# Altium schematic sheet TPS7A88_3V3_1V8_0V9V@2x1A.SchDoc
size A4
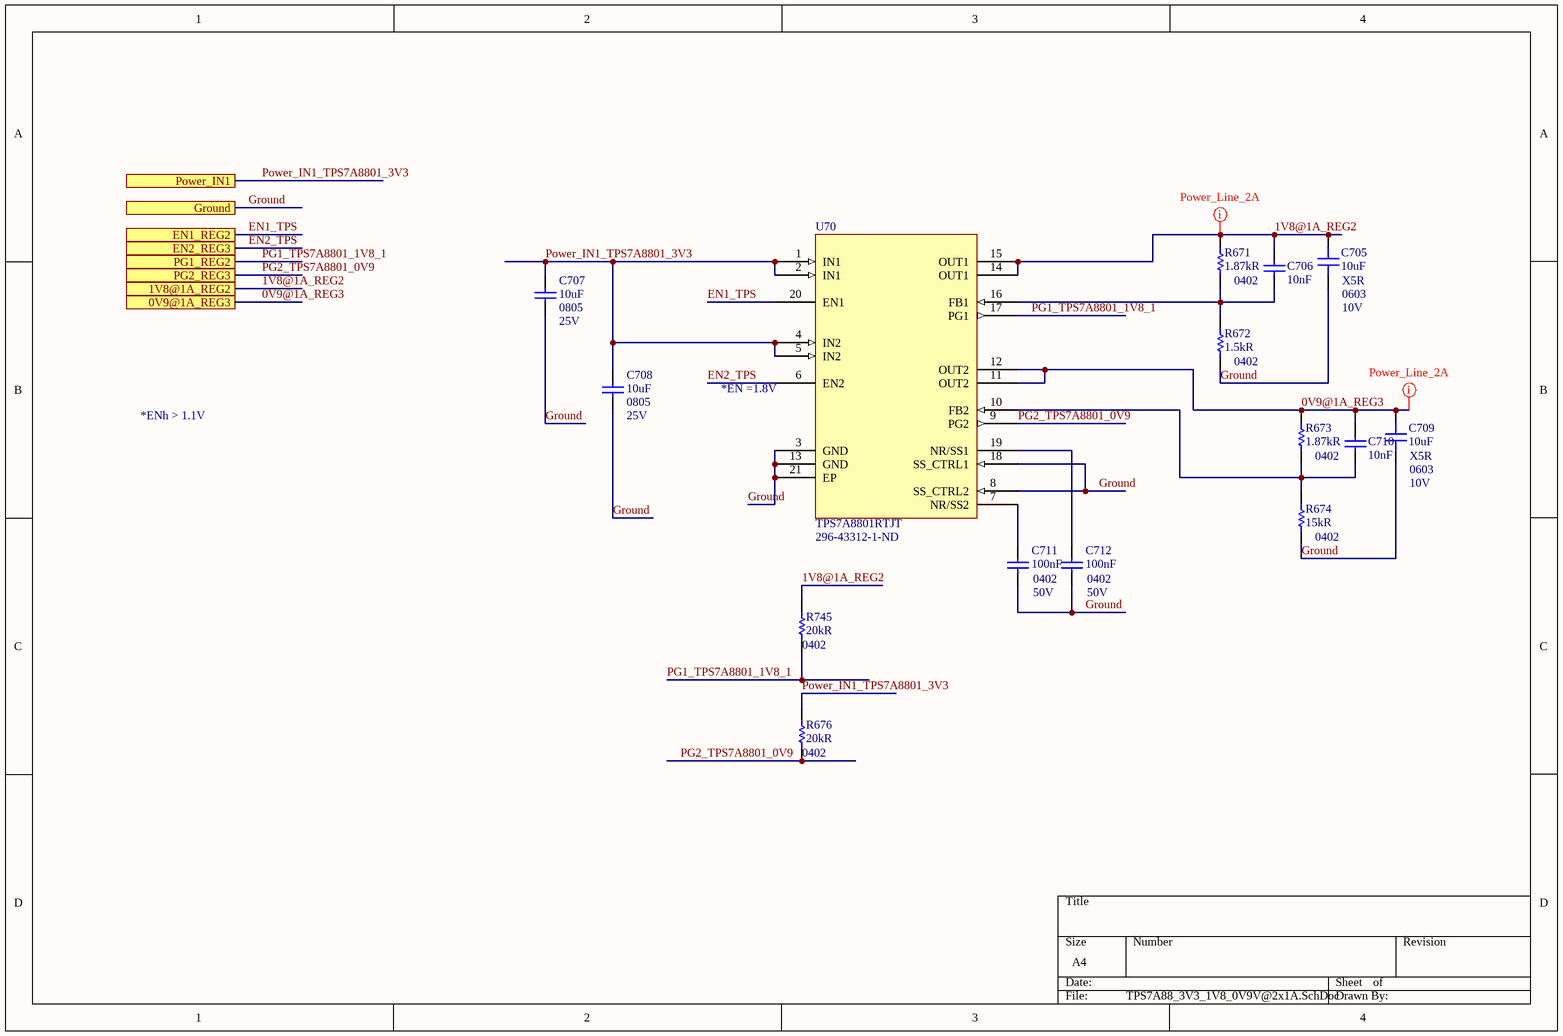
[diagram p0: TPS7A88_3V3_1V8_0V9V@2x1A.SchDoc]

## Parts
C705  10uF  Case/Package: 0603  Dielectric: X5R  Voltage Rating: 10V  [CAP 0603/1608 RF]
C706  10nF  [CAP 0201/0603 KK]
C707  10uF  Case/Package: 0805  Voltage Rating: 25V  [CAP 0805/2012 RF]
C708  10uF  Case/Package: 0805  Voltage Rating: 25V  [CAP 0805/2012 RF]
C709  10uF  Case/Package: 0603  Dielectric: X5R  Voltage: 10V  [CAP 0603/1608 RF]
C710  10nF  [CAP 0201/0603 KK]
C711  100nF  Case Code (Imperial): 0402  Voltage: 50V  [CAP 0402/1005 KK]
C712  100nF  Case Code (Imperial): 0402  Voltage: 50V  [CAP 0402/1005 KK]
R671  1.87kR  Case/Package: 0402  [RES 0402/1005 RF KK]
R672  1.5kR  Case/Package: 0402  [RES 0402/1005 RF KK]
R673  1.87kR  Case/Package: 0402  [RES 0402/1005 RF KK]
R674  15kR  Case Code (Imperial): 0402  [RES 0402/1005 RF KK]
R676  20kR  Case/Package: 0402  [RES 0402/1005 RF KK]
R745  20kR  Case/Package: 0402  [RES 0402/1005 RF KK]
U70  TPS7A8801RTJT  Supplier Part Number 1: 296-43312-1-ND  [TPS7A88]

## Ports
0V9@1A_REG3, 1V8@1A_REG2, EN1_REG2, EN2_REG3, Ground, PG1_REG2, PG2_REG3, Power_IN1

## Nets
0V9@1A_REG3: C709.2 C710.2 R673.2 U70.11(OUT2) U70.12(OUT2) ; port 0V9@1A_REG3
1V8@1A_REG2: C705.2 C706.2 R671.2 R745.1 U70.14(OUT1) U70.15(OUT1) ; port 1V8@1A_REG2
EN1_TPS: U70.20(EN1) ; port EN1_REG2
EN2_TPS: U70.6(EN2) ; port EN2_REG3
Ground: C705.1 C707.1 C708.1 C709.1 C711.1 C712.1 R672.1 R674.1 U70.3(GND) U70.8(SS_CTRL2) U70.13(GND) U70.18(SS_CTRL1) U70.21(EP) ; port Ground
PG1_TPS7A8801_1V8_1: R745.2 U70.17(PG1) ; port PG1_REG2
PG2_TPS7A8801_0V9: R676.2 U70.9(PG2) ; port PG2_REG3
Power_IN1_TPS7A8801_3V3: C707.2 C708.2 R676.1 U70.1(IN1) U70.2(IN1) U70.4(IN2) U70.5(IN2) ; port Power_IN1
NetC706_1: C706.1 R671.1 R672.2 U70.16(FB1)
NetC710_1: C710.1 R673.1 R674.2 U70.10(FB2)
NetC711_2: C711.2 U70.7(NR/SS2)
NetC712_2: C712.2 U70.19(NR/SS1)

## Layout directives
net class Power_Line_2A: 0V9@1A_REG3, 1V8@1A_REG2

## Notes on the sheet
- *ENh > 1.1V
- (near U70) *EN =1.8V

## Library data of the parts
C705 C709 = Capacitor: Manufacturer: Murata; Manufacturer Part Number: GRM188R61A106KE69D; Tolerance: 10%; Supplier 1: Digi-Key; Supplier Part Number 1: 490-10474-1-ND; Stock 1: 4597169; Pricing 1: 1 = 0,21000, 10 = 0,14000, 100 = 0,07110, 500 = 0,04864, 1000 = 0,04303 (USD); RoHS: Yes; Mount: Surface Mount; Case Code (Metric): 1608; Case Code (Imperial): 0603; Min Operating Temperature: -55°C; Max Operating Temperature: 85°C; Capacitance: 10uF; Packaging: Tape and Reel; Voltage Rating (DC): 10V; Length: 1.6mm; Height: 0.8mm; Width: 0.031inch; Thickness: 0.037inch; Depth: 0.8mm; REACH SVHC: No SVHC; Lead Free: Lead Free; ComponentLink1URL: http://components.arrow.com/part/dataview/0323_07281717?src-supplier=Arrow+Europe; ComponentLink1Description: http://components.arrow.com/part/dataview/0323_07281717?src-supplier=Arrow+Europe; ComponentLink2URL: http://www.farnell.com/datasheets/1955682.pdf?src-supplier=Farnell; ComponentLink2Description: http://www.farnell.com/datasheets/1955682.pdf?src-supplier=Farnell; ComponentLink3URL: http://www.mouser.com/ds/2/281/c02e-2905.pdf?src-supplier=Mouser; ComponentLink3Description: http://www.mouser.com/ds/2/281/c02e-2905.pdf?src-supplier=Mouser; ComponentLink4URL: http://search.murata.co.jp/Ceramy/image/img/A01X/G101/ENG/GRM188R61A106KE69-01.pdf?src-supplier=Digi-Key; ComponentLink4Description: http://search.murata.co.jp/Ceramy/image/img/A01X/G101/ENG/GRM188R61A106KE69-01.pdf?src-supplier=Digi-Key; ComponentLink5URL: http://www.farnell.com/datasheets/1955682.pdf?src-supplier=Element14; ComponentLink5Description: http://www.farnell.com/datasheets/1955682.pdf?src-supplier=Element14; ComponentLink6URL: http://www.farnell.com/datasheets/1955682.pdf?src-supplier=Newark; ComponentLink6Description: http://www.farnell.com/datasheets/1955682.pdf?src-supplier=Newark; ComponentLink7URL: http://psearch.en.murata.com/capacitor/product/GRM188R61A106KE69%23.pdf?src-supplier=Avnet; ComponentLink7Description: http://psearch.en.murata.com/capacitor/product/GRM188R61A106KE69%23.pdf?src-supplier=Avnet
  C705: Voltage: 10V
  C709: Voltage Rating: 10V
C706 C710 = Capacitor: CAP CER 10000PF 16V X7R 0201; Manufacturer: Murata; Manufacturer Part Number: GRM033R71C103KE14D; Tolerance: 10%; Supplier 1: Digi-Key; Supplier Part Number 1: 490-14453-1-ND; RoHS: No; Category: Ceramic Capacitors; Stock 1: 188777; Pricing 1: 1=0,10000, 10=0,01900, 100=0,00870, 500=0,00620, 1000=0,00487, 2500=0,00443, 5000=0,00407 (USD); Voltage Rating (DC): 16V; Dielectric: X7R; Capacitance: 10nF; Length: 600um; Width: 300um; Thickness: 300um; ComponentLink1URL: http://www.farnell.com/datasheets/2722745.pdf?src-supplier=Farnell; ComponentLink1Description: http://www.farnell.com/datasheets/2722745.pdf?src-supplier=Farnell; ComponentLink2URL: http://www.farnell.com/datasheets/2722745.pdf?src-supplier=Newark; ComponentLink2Description: http://www.farnell.com/datasheets/2722745.pdf?src-supplier=Newark; ComponentLink3URL: http://www.farnell.com/datasheets/2722745.pdf?src-supplier=Element14; ComponentLink3Description: http://www.farnell.com/datasheets/2722745.pdf?src-supplier=Element14; ComponentLink4URL: http://search.murata.co.jp/Ceramy/image/img/A01X/G101/ENG/GRM033R71C103KE14-01.pdf?src-supplier=Digi-Key; ComponentLink4Description: http://search.murata.co.jp/Ceramy/image/img/A01X/G101/ENG/GRM033R71C103KE14-01.pdf?src-supplier=Digi-Key
C707 C708 = Capacitor: CAP CER 10UF 25V X5R 0805; Manufacturer: KEMET; Manufacturer Part Number: C0805C106K3PACTU; Dielectric Material: Ceramic; Dissipation Factor: 10%; Supplier 1: Digi-Key; Supplier Part Number 1: 399-11939-6-ND; RoHS: Yes; Category: Ceramic Capacitors; Stock 1: 4800; Pricing 1: 1=0,24000, 10=0,16800, 100=0,09510, 500=0,06710, 1000=0,05872 (USD); Mount: Surface Mount; Case Code (Metric): 2012; Case Code (Imperial): 0805; Min Operating Temperature: -55°C; Max Operating Temperature: 85°C; Dielectric: X5R; Packaging: Cut Tape; Voltage: 25V; Termination: Solder; Tolerance: 10%; Voltage Rating (DC): 25V; Capacitance: 10uF; Length: 0.079inch; Height: 1.25mm; Depth: 1.25mm; Width: 0.049inch; Thickness: 0.057inch; REACH SVHC: No SVHC; Lead Free: Lead Free; ComponentLink1URL: http://www.farnell.com/datasheets/2741185.pdf?src-supplier=Farnell; ComponentLink1Description: http://www.farnell.com/datasheets/2741185.pdf?src-supplier=Farnell; ComponentLink2URL: http://www.farnell.com/datasheets/2112054.pdf?src-supplier=Farnell; ComponentLink2Description: http://www.farnell.com/datasheets/2112054.pdf?src-supplier=Farnell; ComponentLink3URL: http://www.alliedelec.com/m/d/f3c02ddb98afa3dd1adcb801109671e9.pdf?src-supplier=Allied+Electronics; ComponentLink3Description: http://www.alliedelec.com/m/d/f3c02ddb98afa3dd1adcb801109671e9.pdf?src-supplier=Allied+Electronics; ComponentLink4URL: http://www.farnell.com/datasheets/2112054.pdf?src-supplier=Element14; ComponentLink4Description: http://www.farnell.com/datasheets/2112054.pdf?src-supplier=Element14; ComponentLink5URL: https://api.kemet.com/component-edge/download/datasheet/C0805C106K3PAC7800.pdf?src-supplier=Digi-Key; ComponentLink5Description: https://api.kemet.com/component-edge/download/datasheet/C0805C106K3PAC7800.pdf?src-supplier=Digi-Key; ComponentLink6URL: http://www.kemet.com/docfinder?Partnumber=C0805C106K3PAC7800&src-supplier=Digi-Key; ComponentLink6Description: http://www.kemet.com/docfinder?Partnumber=C0805C106K3PAC7800&src-supplier=Digi-Key; ComponentLink7URL: http://www.kemet.com/Lists/ProductCatalog/Attachments/19/KEM_C1006_X5R_SMD.pdf?src-supplier=Avnet; ComponentLink7Description: http://www.kemet.com/Lists/ProductCatalog/Attachments/19/KEM_C1006_X5R_SMD.pdf?src-supplier=Avnet
C711 C712 = Capacitor: CAP CER 0.1UF 50V X5R 0402; Manufacturer: Murata; Manufacturer Part Number: GRM155R61H104KE14D; Dielectric Material: Ceramic; Dissipation Factor: 0.025%; Tolerance: 10%; Supplier 1: Digi-Key; Supplier Part Number 1: 490-10697-1-ND; RoHS: Yes; Category: Ceramic Capacitors; Stock 1: 435607; Pricing 1: 1=0,10000, 10=0,04600, 100=0,02050, 500=0,01464, 1000=0,01150, 2500=0,01045, 5000=0,00961 (USD); Mount: Surface Mount; Case/Package: 0402; Weight: 0.000212oz; Case Code (Metric): 1005; Min Operating Temperature: -55°C; Max Operating Temperature: 85°C; Capacitance: 100nF; Packaging: Tape and Reel; Voltage Rating: 50V; Dielectric: X5R; Termination: SMD/SMT; Composition: Ceramic; Voltage Rating (DC): 50V; Package Quantity: 10000; Length: 1mm; Height: 0.5mm; Width: 0.02inch; Thickness: 0.022inch; Depth: 0.5mm; REACH SVHC: No SVHC; Lead Free: Lead Free; ComponentLink1URL: http://www.farnell.com/datasheets/2079150.pdf?src-supplier=Farnell; ComponentLink1Description: http://www.farnell.com/datasheets/2079150.pdf?src-supplier=Farnell; ComponentLink2URL: http://www.mouser.com/ds/2/281/c02e-2905.pdf?src-supplier=Mouser; ComponentLink2Description: http://www.mouser.com/ds/2/281/c02e-2905.pdf?src-supplier=Mouser; ComponentLink3URL: http://www.farnell.com/datasheets/2079150.pdf?src-supplier=Element14; ComponentLink3Description: http://www.farnell.com/datasheets/2079150.pdf?src-supplier=Element14; ComponentLink4URL: http://search.murata.co.jp/Ceramy/image/img/A01X/G101/ENG/GRM155R61H104KE14-01.pdf?src-supplier=Digi-Key; ComponentLink4Description: http://search.murata.co.jp/Ceramy/image/img/A01X/G101/ENG/GRM155R61H104KE14-01.pdf?src-supplier=Digi-Key
R671 R673 = Resistor: Manufacturer: Panasonic; Manufacturer Part Number: ERA-2AEB1871X; Power Rating: 62.5mW; Tolerance: 0.1%; Temperature Coefficient: 25ppm/°C; Max Power Dissipation: 63mW; Supplier 1: Digi-Key; Supplier Part Number 1: P1.87KDCCT-ND; Stock 1: 25484; Pricing 1: 1 = 0,45000, 10 = 0,32100, 100 = 0,12830, 1000 = 0,06322, 2500 = 0,05858, 5000 = 0,05300 (USD); RoHS: Yes; Mount: Surface Mount; Case Code (Metric): 1005; Case Code (Imperial): 0402; Min Operating Temperature: -55°C; Max Operating Temperature: 155°C; Resistance: 1.87kR; Packaging: Tape and Reel; Package Quantity: 10000; Composition: Thin Film; Number of Terminations: 2; Length: 0.039inch; Height: 0.016inch; Width: 0.02inch; Lead Free: Lead Free; ComponentLink1URL: https://media.digikey.com/pdf/Data%20Sheets/Panasonic%20Resistors%20Thermistors%20PDFs/ERA_Series_LE.pdf?src-supplier=Digi-Key; ComponentLink1Description: https://media.digikey.com/pdf/Data%20Sheets/Panasonic%20Resistors%20Thermistors%20PDFs/ERA_Series_LE.pdf?src-supplier=Digi-Key; ComponentLink2URL: http://components.arrow.com/part/dataview/48289000S454828N1386?src-supplier=Arrow; ComponentLink2Description: http://components.arrow.com/part/dataview/48289000S454828N1386?src-supplier=Arrow; ComponentLink3URL: http://www.mouser.com/ds/2/315/AOA0000C237-1100991.pdf?src-supplier=Mouser; ComponentLink3Description: http://www.mouser.com/ds/2/315/AOA0000C237-1100991.pdf?src-supplier=Mouser; ComponentLink4URL: http://www.onlinecomponents.com/datasheet/era-2aeb1871x.aspx?p=44473586&src-supplier=Onlinecomponents.com; ComponentLink4Description: http://www.onlinecomponents.com/datasheet/era-2aeb1871x.aspx?p=44473586&src-supplier=Onlinecomponents.com; ComponentLink5URL: https://industrial.panasonic.com/cdbs/www-data/pdf/RDM0000/AOA0000C307.pdf?src-supplier=Digi-Key; ComponentLink5Description: https://industrial.panasonic.com/cdbs/www-data/pdf/RDM0000/AOA0000C307.pdf?src-supplier=Digi-Key
R672 = Resistor: Manufacturer: Panasonic; Manufacturer Part Number: ERA-2AEB152X; Power Rating: 63mW; Tolerance: 0.1%; Voltage Rating: 25V; Temperature Coefficient: 25ppm/°C; Supplier 1: Digi-Key; Supplier Part Number 1: P1.5KDCCT-ND; Stock 1: 3629; Pricing 1: 1 = 0,43000, 10 = 0,30500, 100 = 0,12220, 1000 = 0,06021, 2500 = 0,05579, 5000 = 0,05047 (USD); RoHS: Yes; Mount: Surface Mount; Case Code (Metric): 1005; Case Code (Imperial): 0402; Contact Plating: Tin; Min Operating Temperature: -55°C; Max Operating Temperature: 155°C; Resistance: 1.5kR; Packaging: Tape and Reel; Package Quantity: 10000; Composition: Thin Film,Metal Film; Number of Terminations: 2; Termination: SMD/SMT; Military Standard: Not; Max Power Dissipation: 63mW; Voltage Rating (DC): 25V; Features: Automotive AEC-Q200; Length: 1mm; Height: 0.35mm; Width: 0.02inch; Depth: 0.5mm; Radiation Hardening: No; REACH SVHC: No SVHC; Lead Free: Lead Free; ComponentLink1URL: https://datasheet.ciiva.com/11812/0900766b80beefcc-11812726.pdf?src-supplier=RSComponents; ComponentLink1Description: https://datasheet.ciiva.com/11812/0900766b80beefcc-11812726.pdf?src-supplier=RSComponents; ComponentLink2URL: https://datasheet.ciiva.com/9198/aoa0000ce26-9198134.pdf?src-supplier=Avnet; ComponentLink2Description: https://datasheet.ciiva.com/9198/aoa0000ce26-9198134.pdf?src-supplier=Avnet; ComponentLink3URL: https://datasheet.ciiva.com/17214/aoa0000ce26-17214729.pdf?src-supplier=Avnet+Europe; ComponentLink3Description: https://datasheet.ciiva.com/17214/aoa0000ce26-17214729.pdf?src-supplier=Avnet+Europe; ComponentLink4URL: https://datasheet.ciiva.com/24071/aoa0000ce26-197354-24071641.pdf?src-supplier=Mouser; ComponentLink4Description: https://datasheet.ciiva.com/24071/aoa0000ce26-197354-24071641.pdf?src-supplier=Mouser
R674 = Resistor: Manufacturer: Panasonic; Manufacturer Part Number: ERJ-2RKF1502X; Tolerance: 1%; Voltage Rating: 50V; Power Rating: 100mW; Temperature Coefficient: 100ppm/°C; Supplier 1: Digi-Key; Supplier Part Number 1: P15.0KLDKR-ND; Stock 1: 3339464; Pricing 1: 1 = 0,10000, 10 = 0,04100, 100 = 0,01670, 1000 = 0,00751, 2500 = 0,00652, 5000 = 0,00538 (USD); RoHS: Yes; Mount: Surface Mount; Case/Package: 0402; Number of Pins: 2; Weight: 2.8E-05oz; Case Code (Metric): 1005; Contact Plating: Tin; Min Operating Temperature: -55°C; Max Operating Temperature: 155°C; Resistance: 15kR; Packaging: Tape and Reel; Package Quantity: 1; Composition: Thick Film; Termination: SMD/SMT; Number of Terminations: 2; Military Standard: Not; Max Power Dissipation: 100mW; Voltage Rating (DC): 50V; Features: Automotive AEC-Q200; Length: 1mm; Height: 0.35mm; Width: 0.5mm; Depth: 0.5mm; Radiation Hardening: No; REACH SVHC: No SVHC; Lead Free: Lead Free; ComponentLink1URL: https://datasheet.ciiva.com/11821/0900766b80f80784-11821181.pdf?src-supplier=RSComponents; ComponentLink1Description: https://datasheet.ciiva.com/11821/0900766b80f80784-11821181.pdf?src-supplier=RSComponents; ComponentLink2URL: https://datasheet.ciiva.com/16778/70260748-16778682.pdf?src-supplier=Allied+Electronics; ComponentLink2Description: https://datasheet.ciiva.com/16778/70260748-16778682.pdf?src-supplier=Allied+Electronics; ComponentLink3URL: https://datasheet.ciiva.com/46372/1678782-46372862.pdf?src-supplier=Element14; ComponentLink3Description: https://datasheet.ciiva.com/46372/1678782-46372862.pdf?src-supplier=Element14; ComponentLink4URL: https://datasheet.ciiva.com/17211/aoa0000ce2-17211535.pdf?src-supplier=Avnet+Europe; ComponentLink4Description: https://datasheet.ciiva.com/17211/aoa0000ce2-17211535.pdf?src-supplier=Avnet+Europe; ComponentLink5URL: https://datasheet.ciiva.com/46372/1678782-46372863.pdf?src-supplier=Element14; ComponentLink5Description: https://datasheet.ciiva.com/46372/1678782-46372863.pdf?src-supplier=Element14; ComponentLink6URL: https://datasheet.ciiva.com/6138/aoa0000ce2-6138166.pdf?src-supplier=Farnell; ComponentLink6Description: https://datasheet.ciiva.com/6138/aoa0000ce2-6138166.pdf?src-supplier=Farnell; ComponentLink7URL: https://datasheet.ciiva.com/16765/70260748-16765542.pdf?src-supplier=Allied+Electronics; ComponentLink7Description: https://datasheet.ciiva.com/16765/70260748-16765542.pdf?src-supplier=Allied+Electronics; ComponentLink8URL: https://datasheet.ciiva.com/43467/1678782-43467414.pdf?src-supplier=Farnell; ComponentLink8Description: https://datasheet.ciiva.com/43467/1678782-43467414.pdf?src-supplier=Farnell; ComponentLink9URL: https://datasheet.ciiva.com/9193/aoa0000ce2-9193047.pdf?src-supplier=Avnet; ComponentLink9Description: https://datasheet.ciiva.com/9193/aoa0000ce2-9193047.pdf?src-supplier=Avnet; ComponentLink10URL: https://datasheet.ciiva.com/8079/426256-8079609.pdf?src-supplier=Element14; ComponentLink10Description: https://datasheet.ciiva.com/8079/426256-8079609.pdf?src-supplier=Element14; ComponentLink11URL: https://datasheet.ciiva.com/16371/aoa0000ce2-16371499.pdf?src-supplier=Future+Electronics; ComponentLink11Description: https://datasheet.ciiva.com/16371/aoa0000ce2-16371499.pdf?src-supplier=Future+Electronics; ComponentLink12URL: https://datasheet.ciiva.com/22687/1678782-22687068.pdf?src-supplier=Element14; ComponentLink12Description: https://datasheet.ciiva.com/22687/1678782-22687068.pdf?src-supplier=Element14
R676 R745 = Resistor: Manufacturer: Panasonic; Manufacturer Part Number: ERJ-2RKF2002X; Power Rating: 100mW; Tolerance: 1%; Voltage Rating: 50V; Temperature Coefficient: 100ppm/°C; Supplier 1: Digi-Key; Supplier Part Number 1: P20.0KLCT-ND; Stock 1: 2516725; Pricing 1: 1 = 0,10000, 10 = 0,05000, 100 = 0,02050, 1000 = 0,00920, 2500 = 0,00798, 5000 = 0,00660 (USD); RoHS: Yes; Mount: Surface Mount; Weight: 2.8E-05oz; Case Code (Metric): 1005; Case Code (Imperial): 0402; Contact Plating: Tin; Min Operating Temperature: -55°C; Max Operating Temperature: 155°C; Resistance: 20kR; Packaging: Cut Tape; Package Quantity: 1; Composition: Thick Film; Number of Terminations: 2; Termination: SMD/SMT; Military Standard: Not; Max Power Dissipation: 100mW; Voltage Rating (DC): 50V; Features: Automotive AEC-Q200; Length: 1mm; Height: 0.35mm; Width: 0.02inch; Depth: 0.5mm; Radiation Hardening: No; REACH SVHC: No SVHC; Lead Free: Lead Free; ComponentLink1URL: https://datasheet.ciiva.com/11821/0900766b80f80784-11821220.pdf?src-supplier=RSComponents; ComponentLink1Description: https://datasheet.ciiva.com/11821/0900766b80f80784-11821220.pdf?src-supplier=RSComponents; ComponentLink2URL: https://datasheet.ciiva.com/16762/70260748-16762885.pdf?src-supplier=Allied+Electronics; ComponentLink2Description: https://datasheet.ciiva.com/16762/70260748-16762885.pdf?src-supplier=Allied+Electronics; ComponentLink3URL: https://datasheet.ciiva.com/16782/70260748-16782455.pdf?src-supplier=Allied+Electronics; ComponentLink3Description: https://datasheet.ciiva.com/16782/70260748-16782455.pdf?src-supplier=Allied+Electronics; ComponentLink4URL: https://datasheet.ciiva.com/48531/aoa0000ce2-48531063.pdf?src-supplier=Avnet; ComponentLink4Description: https://datasheet.ciiva.com/48531/aoa0000ce2-48531063.pdf?src-supplier=Avnet; ComponentLink5URL: https://datasheet.ciiva.com/28688/1678782-28688600.pdf?src-supplier=Element14; ComponentLink5Description: https://datasheet.ciiva.com/28688/1678782-28688600.pdf?src-supplier=Element14; ComponentLink6URL: https://datasheet.ciiva.com/46377/426256-46377368.pdf?src-supplier=Element14; ComponentLink6Description: https://datasheet.ciiva.com/46377/426256-46377368.pdf?src-supplier=Element14; ComponentLink7URL: https://datasheet.ciiva.com/6138/426256-6138761.pdf?src-supplier=Farnell; ComponentLink7Description: https://datasheet.ciiva.com/6138/426256-6138761.pdf?src-supplier=Farnell; ComponentLink8URL: https://datasheet.ciiva.com/24159/aoa0000ce2-24159274.pdf?src-supplier=Mouser; ComponentLink8Description: https://datasheet.ciiva.com/24159/aoa0000ce2-24159274.pdf?src-supplier=Mouser; ComponentLink9URL: https://datasheet.ciiva.com/16508/aoa0000ce2-16508524.pdf?src-supplier=Future+Electronics; ComponentLink9Description: https://datasheet.ciiva.com/16508/aoa0000ce2-16508524.pdf?src-supplier=Future+Electronics; ComponentLink10URL: https://datasheet.ciiva.com/16514/aoa0000ce2-16514269.pdf?src-supplier=Avnet+Asia; ComponentLink10Description: https://datasheet.ciiva.com/16514/aoa0000ce2-16514269.pdf?src-supplier=Avnet+Asia; ComponentLink11URL: https://datasheet.ciiva.com/30049/aoa0000ce2-30049982.pdf?src-supplier=Onlinecomponents.com; ComponentLink11Description: https://datasheet.ciiva.com/30049/aoa0000ce2-30049982.pdf?src-supplier=Onlinecomponents.com
U70 = TPS7A8801RTJT: IC REG LINEAR POS ADJ 1A 20QFN; Manufacturer: Texas Instruments; Output Voltage: 5V; Number of Regulators: 2; Min Current Limit: 1.5A; Quiescent Current: 2mA; Dropout Voltage: 130mV; Supplier 1: Digi-Key; Manufacturer Part Number: TPS7A8801RTJT; RoHS: Yes; Category: Voltage References; Stock 1: 1455; Pricing 1: 1=2,77000, 10=2,48700, 25=2,34600, 100=1,87670 (USD); Mount: Surface Mount; Case/Package: QFN; Number of Pins: 20; Min Operating Temperature: -40°C; Max Operating Temperature: 125°C; Packaging: Tape and Reel; Output Current: 1A; Number of Outputs: 2; Lead Free: Lead Free; ComponentLink1URL: http://www.ti.com/lit/gpn/tps7a88?src-supplier=Mouser; ComponentLink1Description: http://www.ti.com/lit/gpn/tps7a88?src-supplier=Mouser; ComponentLink2URL: http://www.ti.com/lit/ds/symlink/tps7a88.pdf?src-supplier=Digi-Key; ComponentLink2Description: http://www.ti.com/lit/ds/symlink/tps7a88.pdf?src-supplier=Digi-Key; ComponentLink3URL: http://www.ti.com/general/docs/lit/getliterature.tsp?genericPartNumber=TPS7A88&amp;&amp;fileType=pdf&src-supplier=Farnell; ComponentLink3Description: http://www.ti.com/general/docs/lit/getliterature.tsp?genericPartNumber=TPS7A88&amp;&amp;fileType=pdf&src-supplier=Farnell